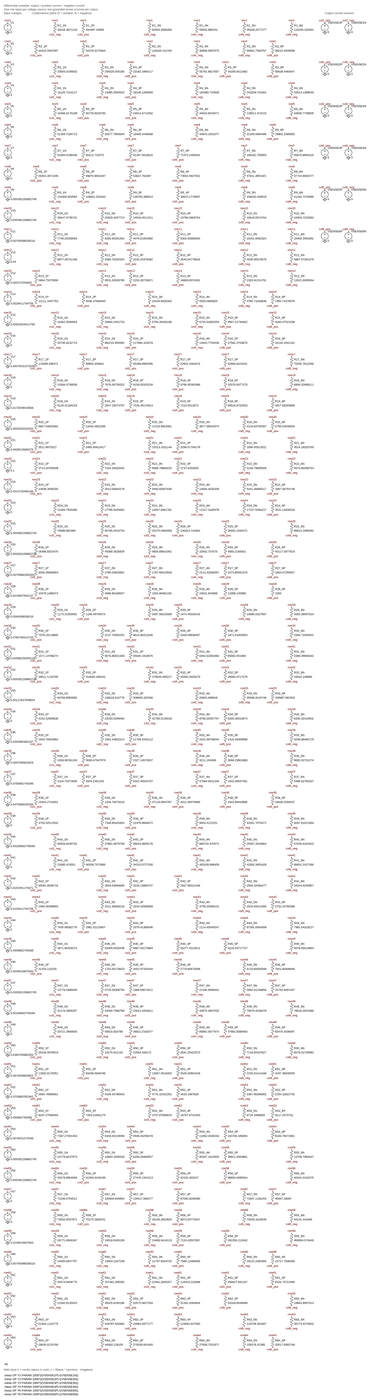
[diagram p0: schematic mnist_digit_3.asc, whole sheet]
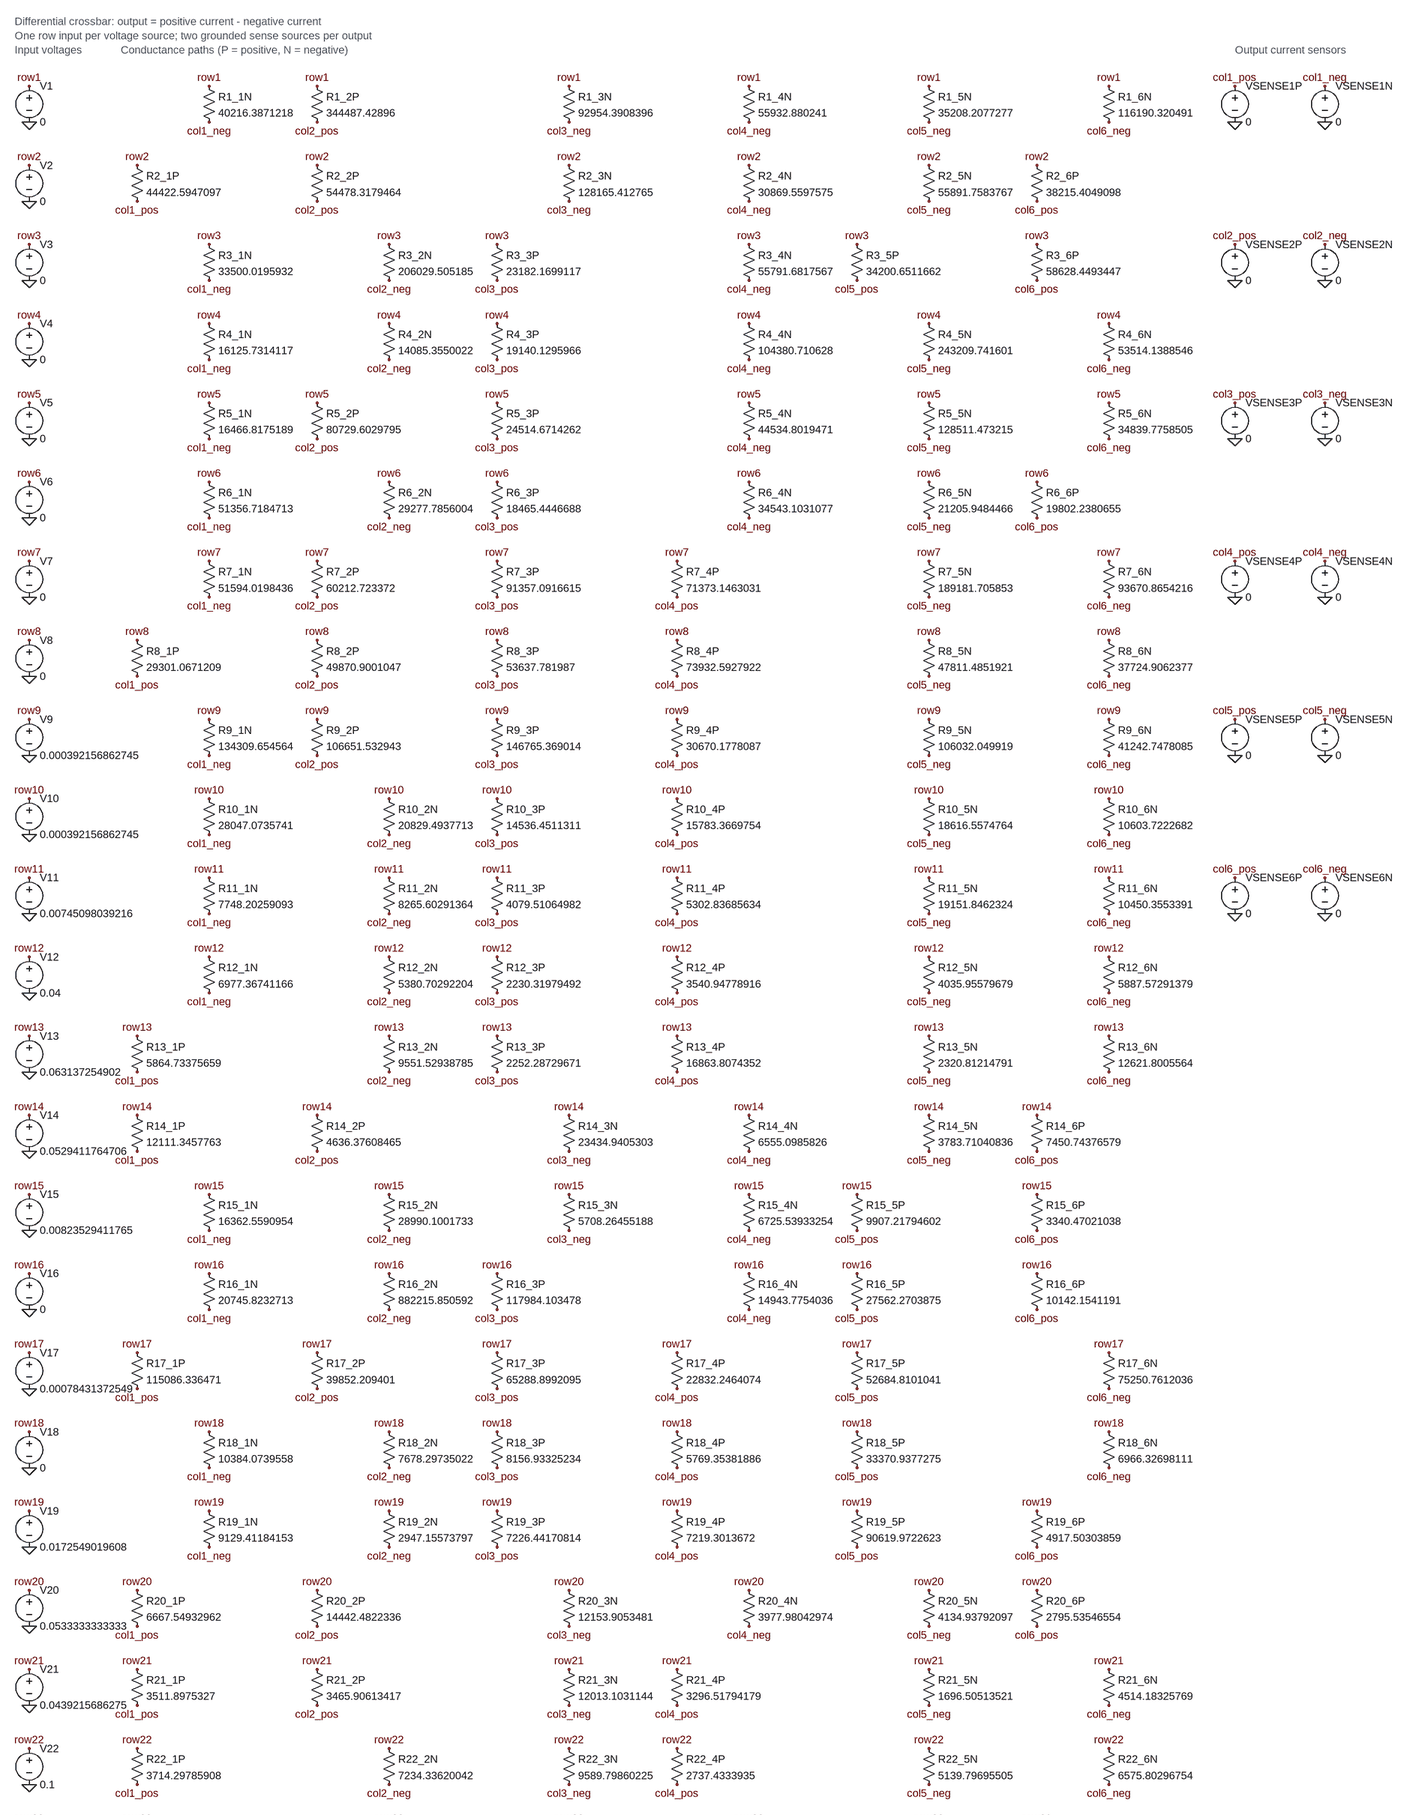
[diagram p1: schematic mnist_digit_3.asc, part, row 1 of 3, column 1 of 1]
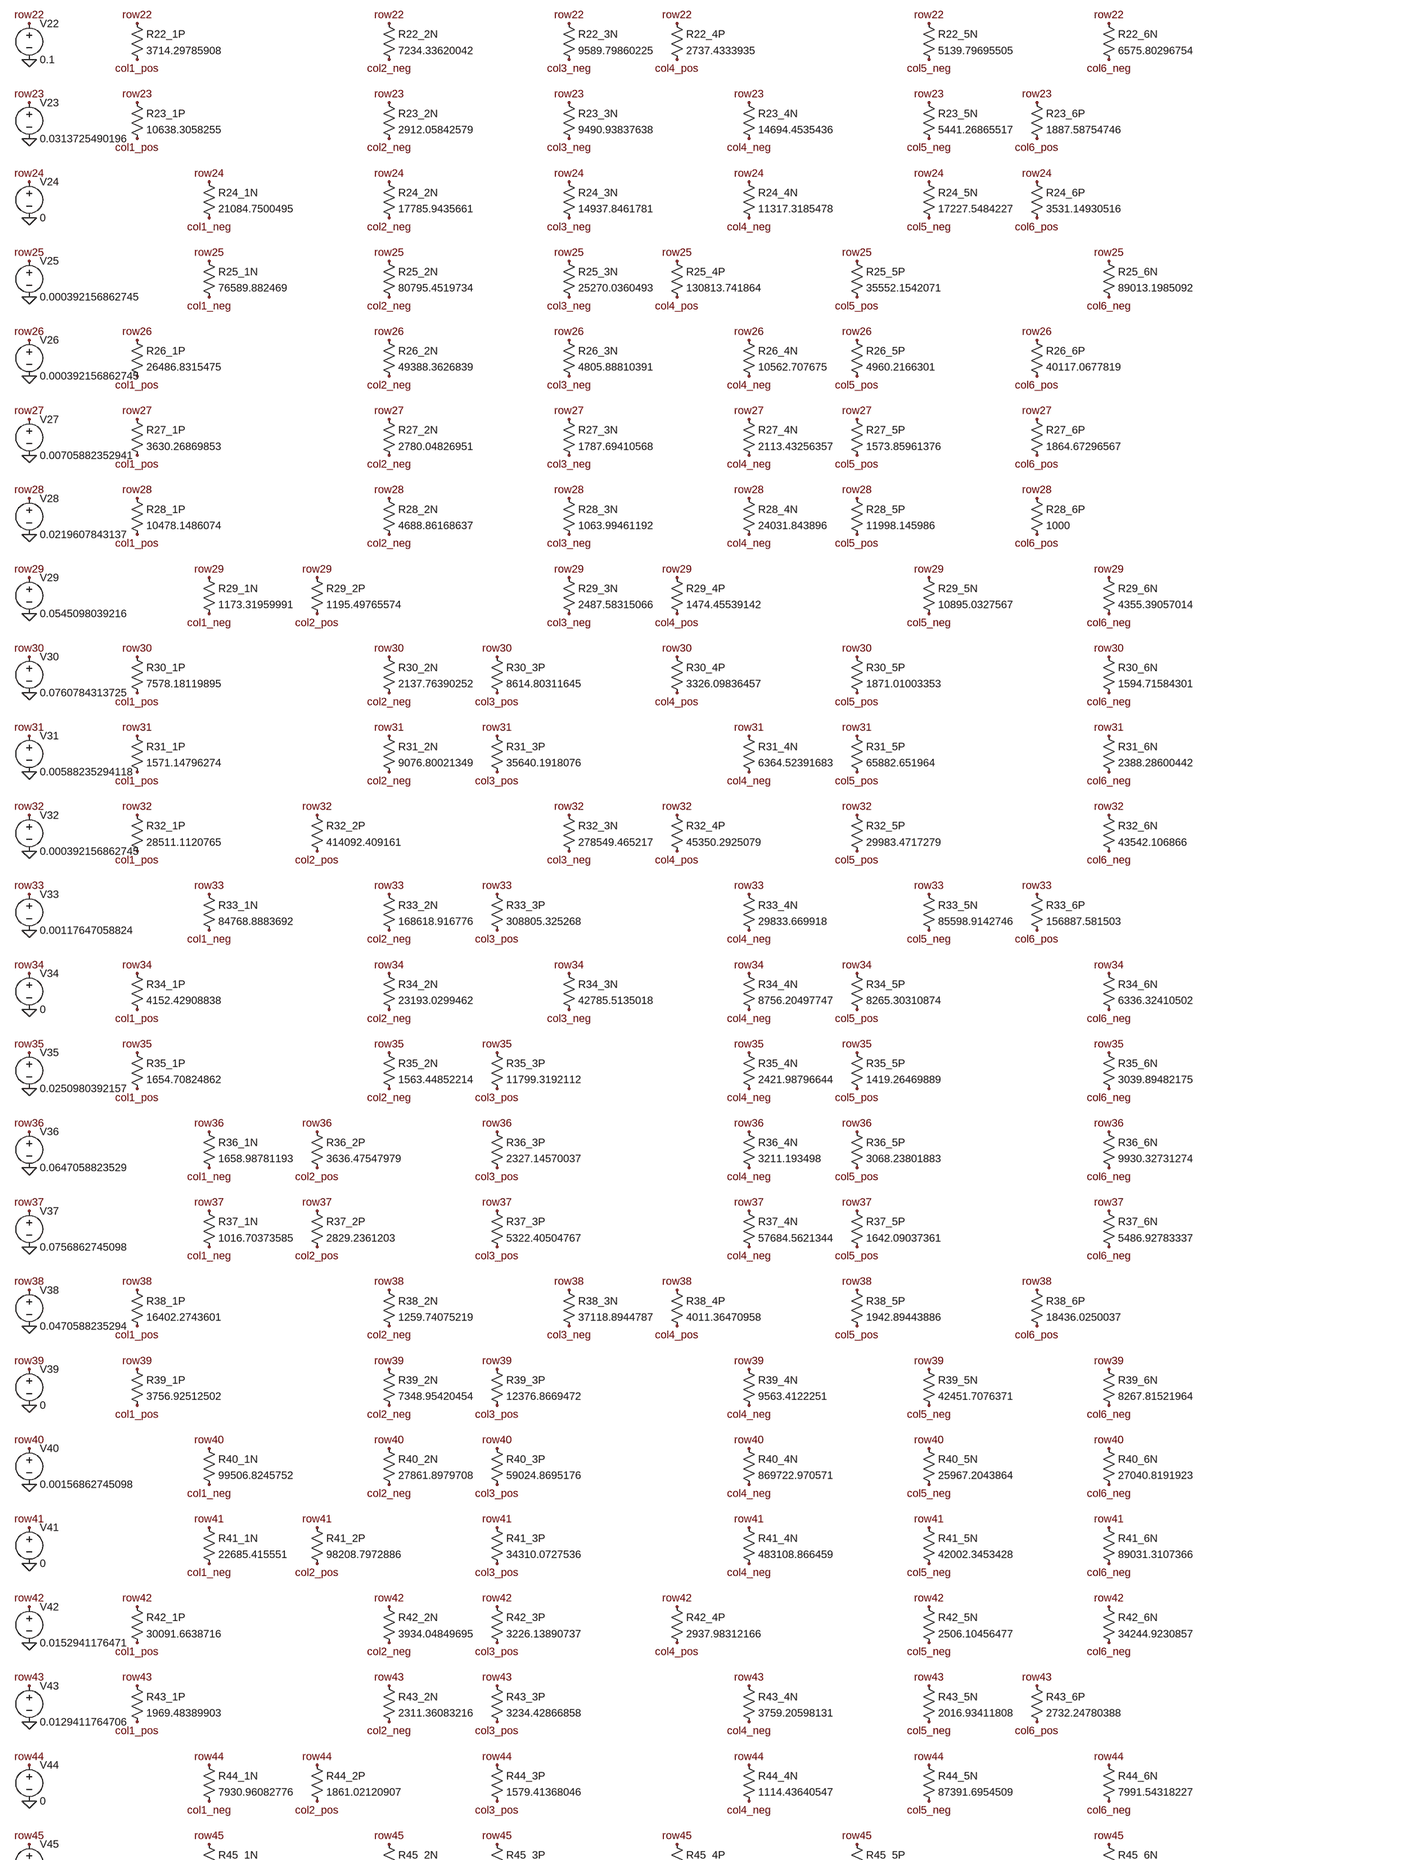
[diagram p2: schematic mnist_digit_3.asc, part, row 2 of 3, column 1 of 1]
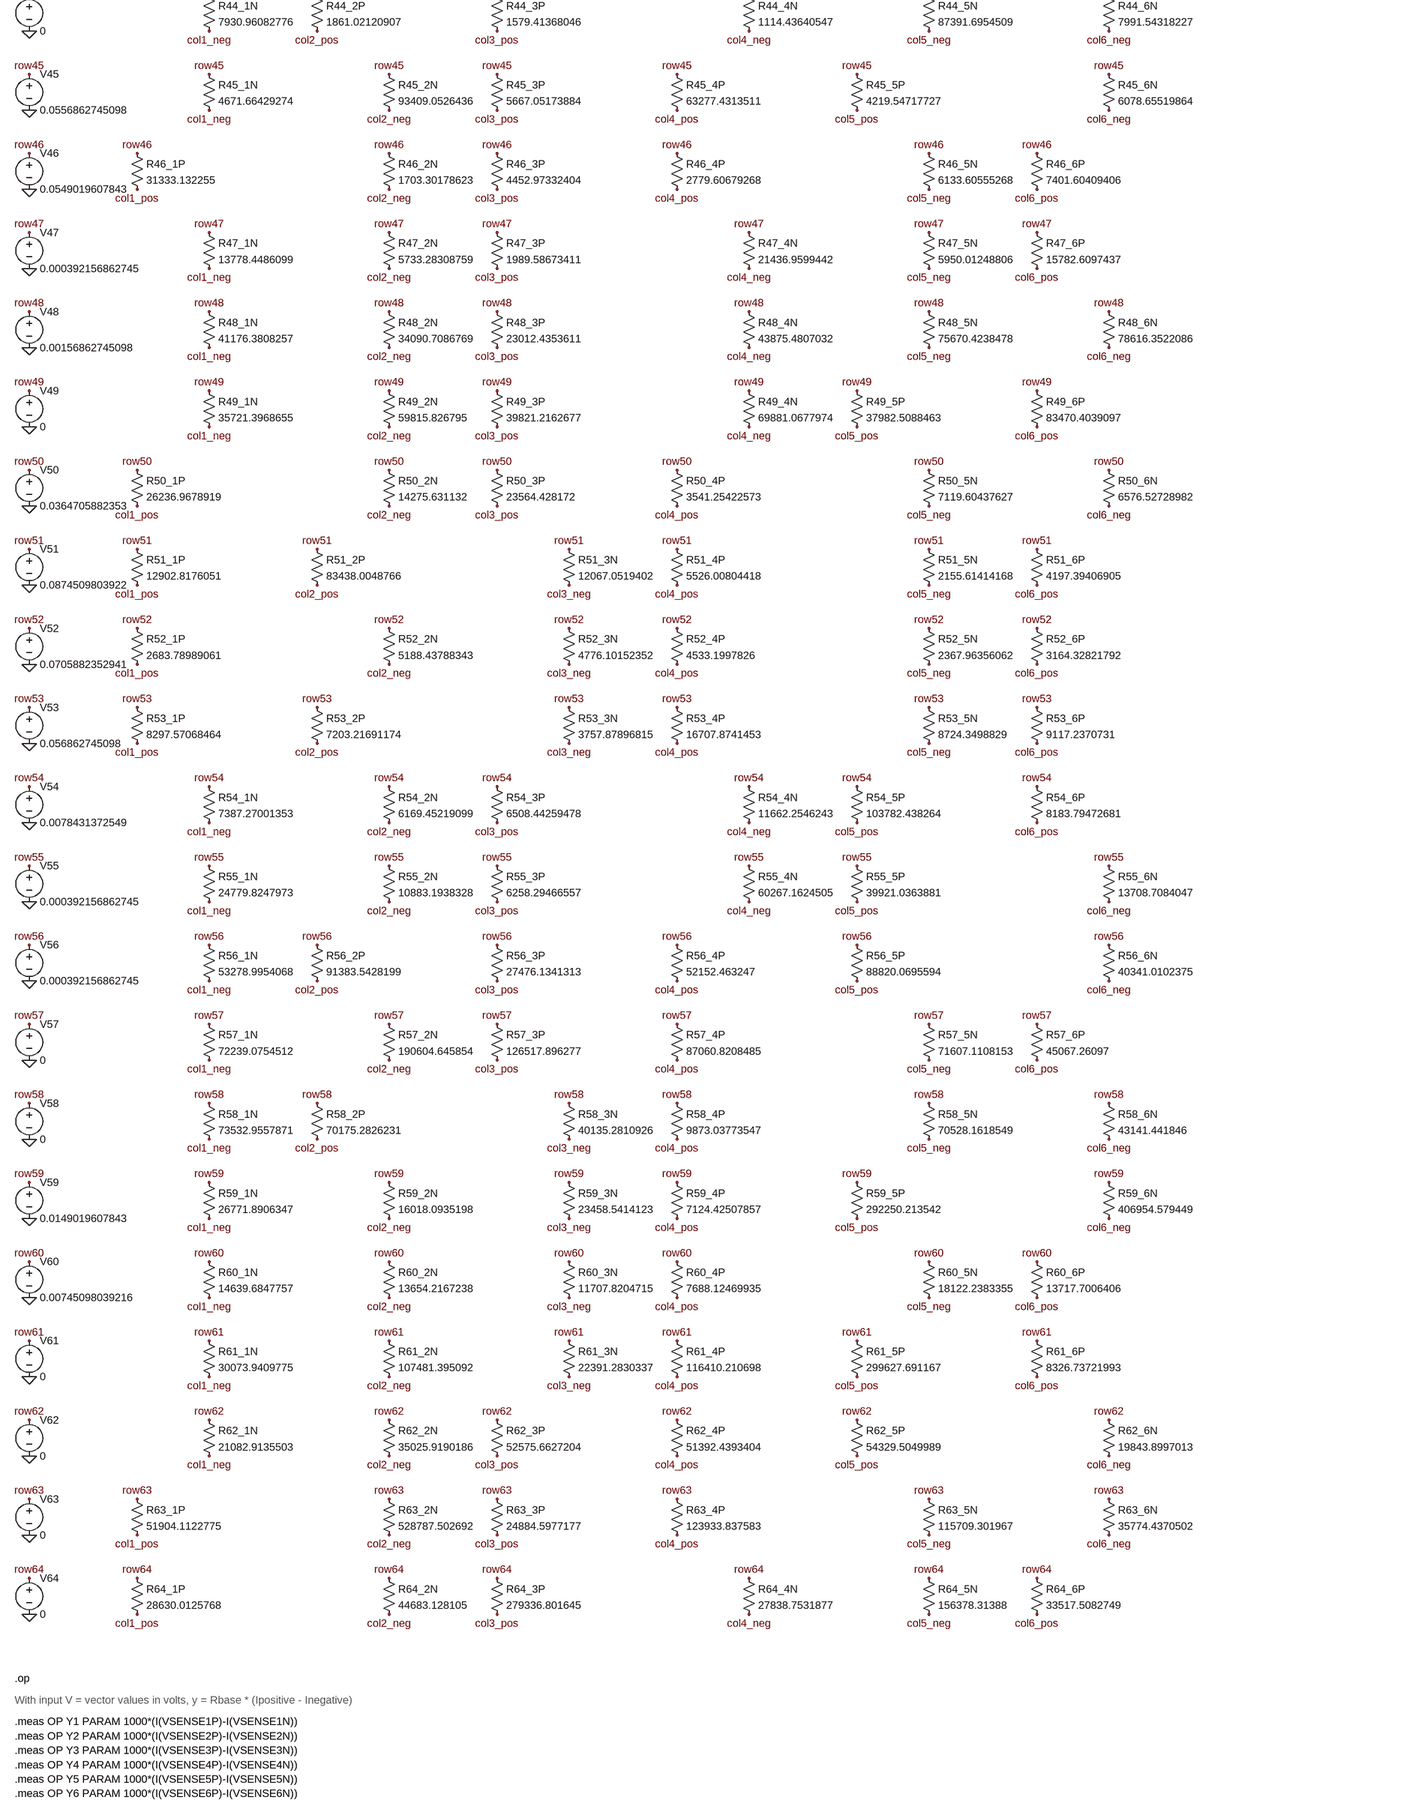
[diagram p3: schematic mnist_digit_3.asc, part, row 3 of 3, column 1 of 1]
* mnist_digit_3.asc
V1 row1 0 0
V2 row2 0 0
V3 row3 0 0
V4 row4 0 0
V5 row5 0 0
V6 row6 0 0
V7 row7 0 0
V8 row8 0 0
V9 row9 0 0.000392156862745
V10 row10 0 0.000392156862745
V11 row11 0 0.00745098039216
V12 row12 0 0.04
V13 row13 0 0.063137254902
V14 row14 0 0.0529411764706
V15 row15 0 0.00823529411765
V16 row16 0 0
V17 row17 0 0.00078431372549
V18 row18 0 0
V19 row19 0 0.0172549019608
V20 row20 0 0.0533333333333
V21 row21 0 0.0439215686275
V22 row22 0 0.1
V23 row23 0 0.0313725490196
V24 row24 0 0
V25 row25 0 0.000392156862745
V26 row26 0 0.000392156862745
V27 row27 0 0.00705882352941
V28 row28 0 0.0219607843137
V29 row29 0 0.0545098039216
V30 row30 0 0.0760784313725
V31 row31 0 0.00588235294118
V32 row32 0 0.000392156862745
V33 row33 0 0.00117647058824
V34 row34 0 0
V35 row35 0 0.0250980392157
V36 row36 0 0.0647058823529
V37 row37 0 0.0756862745098
V38 row38 0 0.0470588235294
V39 row39 0 0
V40 row40 0 0.00156862745098
V41 row41 0 0
V42 row42 0 0.0152941176471
V43 row43 0 0.0129411764706
V44 row44 0 0
V45 row45 0 0.0556862745098
V46 row46 0 0.0549019607843
V47 row47 0 0.000392156862745
V48 row48 0 0.00156862745098
V49 row49 0 0
V50 row50 0 0.0364705882353
V51 row51 0 0.0874509803922
V52 row52 0 0.0705882352941
V53 row53 0 0.056862745098
V54 row54 0 0.0078431372549
V55 row55 0 0.000392156862745
V56 row56 0 0.000392156862745
V57 row57 0 0
V58 row58 0 0
V59 row59 0 0.0149019607843
V60 row60 0 0.00745098039216
V61 row61 0 0
V62 row62 0 0
V63 row63 0 0
V64 row64 0 0
R1_1N row1 col1_neg 40216.3871218
R1_2P row1 col2_pos 344487.42896
R1_3N row1 col3_neg 92954.3908396
R1_4N row1 col4_neg 55932.880241
R1_5N row1 col5_neg 35208.2077277
R1_6N row1 col6_neg 116190.320491
R2_1P row2 col1_pos 44422.5947097
R2_2P row2 col2_pos 54478.3179464
R2_3N row2 col3_neg 128165.412765
R2_4N row2 col4_neg 30869.5597575
R2_5N row2 col5_neg 55891.7583767
R2_6P row2 col6_pos 38215.4049098
R3_1N row3 col1_neg 33500.0195932
R3_2N row3 col2_neg 206029.505185
R3_3P row3 col3_pos 23182.1699117
R3_4N row3 col4_neg 55791.6817567
R3_5P row3 col5_pos 34200.6511662
R3_6P row3 col6_pos 58628.4493447
R4_1N row4 col1_neg 16125.7314117
R4_2N row4 col2_neg 14085.3550022
R4_3P row4 col3_pos 19140.1295966
R4_4N row4 col4_neg 104380.710628
R4_5N row4 col5_neg 243209.741601
R4_6N row4 col6_neg 53514.1388546
R5_1N row5 col1_neg 16466.8175189
R5_2P row5 col2_pos 80729.6029795
R5_3P row5 col3_pos 24514.6714262
R5_4N row5 col4_neg 44534.8019471
R5_5N row5 col5_neg 128511.473215
R5_6N row5 col6_neg 34839.7758505
R6_1N row6 col1_neg 51356.7184713
R6_2N row6 col2_neg 29277.7856004
R6_3P row6 col3_pos 18465.4446688
R6_4N row6 col4_neg 34543.1031077
R6_5N row6 col5_neg 21205.9484466
R6_6P row6 col6_pos 19802.2380655
R7_1N row7 col1_neg 51594.0198436
R7_2P row7 col2_pos 60212.723372
R7_3P row7 col3_pos 91357.0916615
R7_4P row7 col4_pos 71373.1463031
R7_5N row7 col5_neg 189181.705853
R7_6N row7 col6_neg 93670.8654216
R8_1P row8 col1_pos 29301.0671209
R8_2P row8 col2_pos 49870.9001047
R8_3P row8 col3_pos 53637.781987
R8_4P row8 col4_pos 73932.5927922
R8_5N row8 col5_neg 47811.4851921
R8_6N row8 col6_neg 37724.9062377
R9_1N row9 col1_neg 134309.654564
R9_2P row9 col2_pos 106651.532943
R9_3P row9 col3_pos 146765.369014
R9_4P row9 col4_pos 30670.1778087
R9_5N row9 col5_neg 106032.049919
R9_6N row9 col6_neg 41242.7478085
R10_1N row10 col1_neg 28047.0735741
R10_2N row10 col2_neg 20829.4937713
R10_3P row10 col3_pos 14536.4511311
R10_4P row10 col4_pos 15783.3669754
R10_5N row10 col5_neg 18616.5574764
R10_6N row10 col6_neg 10603.7222682
R11_1N row11 col1_neg 7748.20259093
R11_2N row11 col2_neg 8265.60291364
R11_3P row11 col3_pos 4079.51064982
R11_4P row11 col4_pos 5302.83685634
R11_5N row11 col5_neg 19151.8462324
R11_6N row11 col6_neg 10450.3553391
R12_1N row12 col1_neg 6977.36741166
R12_2N row12 col2_neg 5380.70292204
R12_3P row12 col3_pos 2230.31979492
R12_4P row12 col4_pos 3540.94778916
R12_5N row12 col5_neg 4035.95579679
R12_6N row12 col6_neg 5887.57291379
R13_1P row13 col1_pos 5864.73375659
R13_2N row13 col2_neg 9551.52938785
R13_3P row13 col3_pos 2252.28729671
R13_4P row13 col4_pos 16863.8074352
R13_5N row13 col5_neg 2320.81214791
R13_6N row13 col6_neg 12621.8005564
R14_1P row14 col1_pos 12111.3457763
R14_2P row14 col2_pos 4636.37608465
R14_3N row14 col3_neg 23434.9405303
R14_4N row14 col4_neg 6555.0985826
R14_5N row14 col5_neg 3783.71040836
R14_6P row14 col6_pos 7450.74376579
R15_1N row15 col1_neg 16362.5590954
R15_2N row15 col2_neg 28990.1001733
R15_3N row15 col3_neg 5708.26455188
R15_4N row15 col4_neg 6725.53933254
R15_5P row15 col5_pos 9907.21794602
R15_6P row15 col6_pos 3340.47021038
R16_1N row16 col1_neg 20745.8232713
R16_2N row16 col2_neg 882215.850592
R16_3P row16 col3_pos 117984.103478
R16_4N row16 col4_neg 14943.7754036
R16_5P row16 col5_pos 27562.2703875
R16_6P row16 col6_pos 10142.1541191
R17_1P row17 col1_pos 115086.336471
R17_2P row17 col2_pos 39852.209401
R17_3P row17 col3_pos 65288.8992095
R17_4P row17 col4_pos 22832.2464074
R17_5P row17 col5_pos 52684.8101041
R17_6N row17 col6_neg 75250.7612036
R18_1N row18 col1_neg 10384.0739558
R18_2N row18 col2_neg 7678.29735022
R18_3P row18 col3_pos 8156.93325234
R18_4P row18 col4_pos 5769.35381886
R18_5P row18 col5_pos 33370.9377275
R18_6N row18 col6_neg 6966.32698111
R19_1N row19 col1_neg 9129.41184153
R19_2N row19 col2_neg 2947.15573797
R19_3P row19 col3_pos 7226.44170814
R19_4P row19 col4_pos 7219.3013672
R19_5P row19 col5_pos 90619.9722623
R19_6P row19 col6_pos 4917.50303859
R20_1P row20 col1_pos 6667.54932962
R20_2P row20 col2_pos 14442.4822336
R20_3N row20 col3_neg 12153.9053481
R20_4N row20 col4_neg 3977.98042974
R20_5N row20 col5_neg 4134.93792097
R20_6P row20 col6_pos 2795.53546554
R21_1P row21 col1_pos 3511.8975327
R21_2P row21 col2_pos 3465.90613417
R21_3N row21 col3_neg 12013.1031144
R21_4P row21 col4_pos 3296.51794179
R21_5N row21 col5_neg 1696.50513521
R21_6N row21 col6_neg 4514.18325769
R22_1P row22 col1_pos 3714.29785908
R22_2N row22 col2_neg 7234.33620042
R22_3N row22 col3_neg 9589.79860225
R22_4P row22 col4_pos 2737.4333935
R22_5N row22 col5_neg 5139.79695505
R22_6N row22 col6_neg 6575.80296754
R23_1P row23 col1_pos 10638.3058255
R23_2N row23 col2_neg 2912.05842579
R23_3N row23 col3_neg 9490.93837638
R23_4N row23 col4_neg 14694.4535436
R23_5N row23 col5_neg 5441.26865517
R23_6P row23 col6_pos 1887.58754746
R24_1N row24 col1_neg 21084.7500495
R24_2N row24 col2_neg 17785.9435661
R24_3N row24 col3_neg 14937.8461781
R24_4N row24 col4_neg 11317.3185478
R24_5N row24 col5_neg 17227.5484227
R24_6P row24 col6_pos 3531.14930516
R25_1N row25 col1_neg 76589.882469
R25_2N row25 col2_neg 80795.4519734
R25_3N row25 col3_neg 25270.0360493
R25_4P row25 col4_pos 130813.741864
R25_5P row25 col5_pos 35552.1542071
R25_6N row25 col6_neg 89013.1985092
R26_1P row26 col1_pos 26486.8315475
R26_2N row26 col2_neg 49388.3626839
R26_3N row26 col3_neg 4805.88810391
R26_4N row26 col4_neg 10562.707675
R26_5P row26 col5_pos 4960.2166301
R26_6P row26 col6_pos 40117.0677819
R27_1P row27 col1_pos 3630.26869853
R27_2N row27 col2_neg 2780.04826951
R27_3N row27 col3_neg 1787.69410568
R27_4N row27 col4_neg 2113.43256357
R27_5P row27 col5_pos 1573.85961376
R27_6P row27 col6_pos 1864.67296567
R28_1P row28 col1_pos 10478.1486074
R28_2N row28 col2_neg 4688.86168637
R28_3N row28 col3_neg 1063.99461192
R28_4N row28 col4_neg 24031.843896
R28_5P row28 col5_pos 11998.145986
R28_6P row28 col6_pos 1000
R29_1N row29 col1_neg 1173.31959991
R29_2P row29 col2_pos 1195.49765574
R29_3N row29 col3_neg 2487.58315066
R29_4P row29 col4_pos 1474.45539142
R29_5N row29 col5_neg 10895.0327567
R29_6N row29 col6_neg 4355.39057014
R30_1P row30 col1_pos 7578.18119895
R30_2N row30 col2_neg 2137.76390252
R30_3P row30 col3_pos 8614.80311645
R30_4P row30 col4_pos 3326.09836457
R30_5P row30 col5_pos 1871.01003353
R30_6N row30 col6_neg 1594.71584301
R31_1P row31 col1_pos 1571.14796274
R31_2N row31 col2_neg 9076.80021349
R31_3P row31 col3_pos 35640.1918076
R31_4N row31 col4_neg 6364.52391683
R31_5P row31 col5_pos 65882.651964
R31_6N row31 col6_neg 2388.28600442
R32_1P row32 col1_pos 28511.1120765
R32_2P row32 col2_pos 414092.409161
R32_3N row32 col3_neg 278549.465217
R32_4P row32 col4_pos 45350.2925079
R32_5P row32 col5_pos 29983.4717279
R32_6N row32 col6_neg 43542.106866
R33_1N row33 col1_neg 84768.8883692
R33_2N row33 col2_neg 168618.916776
R33_3P row33 col3_pos 308805.325268
R33_4N row33 col4_neg 29833.669918
R33_5N row33 col5_neg 85598.9142746
R33_6P row33 col6_pos 156887.581503
R34_1P row34 col1_pos 4152.42908838
R34_2N row34 col2_neg 23193.0299462
R34_3N row34 col3_neg 42785.5135018
R34_4N row34 col4_neg 8756.20497747
R34_5P row34 col5_pos 8265.30310874
R34_6N row34 col6_neg 6336.32410502
R35_1P row35 col1_pos 1654.70824862
R35_2N row35 col2_neg 1563.44852214
R35_3P row35 col3_pos 11799.3192112
R35_4N row35 col4_neg 2421.98796644
R35_5P row35 col5_pos 1419.26469889
R35_6N row35 col6_neg 3039.89482175
R36_1N row36 col1_neg 1658.98781193
R36_2P row36 col2_pos 3636.47547979
R36_3P row36 col3_pos 2327.14570037
R36_4N row36 col4_neg 3211.193498
R36_5P row36 col5_pos 3068.23801883
R36_6N row36 col6_neg 9930.32731274
R37_1N row37 col1_neg 1016.70373585
R37_2P row37 col2_pos 2829.2361203
R37_3P row37 col3_pos 5322.40504767
R37_4N row37 col4_neg 57684.5621344
R37_5P row37 col5_pos 1642.09037361
R37_6N row37 col6_neg 5486.92783337
R38_1P row38 col1_pos 16402.2743601
R38_2N row38 col2_neg 1259.74075219
R38_3N row38 col3_neg 37118.8944787
R38_4P row38 col4_pos 4011.36470958
R38_5P row38 col5_pos 1942.89443886
R38_6P row38 col6_pos 18436.0250037
R39_1P row39 col1_pos 3756.92512502
R39_2N row39 col2_neg 7348.95420454
R39_3P row39 col3_pos 12376.8669472
R39_4N row39 col4_neg 9563.4122251
R39_5N row39 col5_neg 42451.7076371
R39_6N row39 col6_neg 8267.81521964
R40_1N row40 col1_neg 99506.8245752
R40_2N row40 col2_neg 27861.8979708
R40_3P row40 col3_pos 59024.8695176
R40_4N row40 col4_neg 869722.970571
R40_5N row40 col5_neg 25967.2043864
R40_6N row40 col6_neg 27040.8191923
R41_1N row41 col1_neg 22685.415551
R41_2P row41 col2_pos 98208.7972886
R41_3P row41 col3_pos 34310.0727536
R41_4N row41 col4_neg 483108.866459
R41_5N row41 col5_neg 42002.3453428
R41_6N row41 col6_neg 89031.3107366
R42_1P row42 col1_pos 30091.6638716
R42_2N row42 col2_neg 3934.04849695
R42_3P row42 col3_pos 3226.13890737
R42_4P row42 col4_pos 2937.98312166
R42_5N row42 col5_neg 2506.10456477
R42_6N row42 col6_neg 34244.9230857
R43_1P row43 col1_pos 1969.48389903
R43_2N row43 col2_neg 2311.36083216
R43_3P row43 col3_pos 3234.42866858
R43_4N row43 col4_neg 3759.20598131
R43_5N row43 col5_neg 2016.93411808
R43_6P row43 col6_pos 2732.24780388
R44_1N row44 col1_neg 7930.96082776
R44_2P row44 col2_pos 1861.02120907
R44_3P row44 col3_pos 1579.41368046
R44_4N row44 col4_neg 1114.43640547
R44_5N row44 col5_neg 87391.6954509
R44_6N row44 col6_neg 7991.54318227
R45_1N row45 col1_neg 4671.66429274
R45_2N row45 col2_neg 93409.0526436
R45_3P row45 col3_pos 5667.05173884
R45_4P row45 col4_pos 63277.4313511
R45_5P row45 col5_pos 4219.54717727
R45_6N row45 col6_neg 6078.65519864
R46_1P row46 col1_pos 31333.132255
R46_2N row46 col2_neg 1703.30178623
R46_3P row46 col3_pos 4452.97332404
R46_4P row46 col4_pos 2779.60679268
R46_5N row46 col5_neg 6133.60555268
R46_6P row46 col6_pos 7401.60409406
R47_1N row47 col1_neg 13778.4486099
R47_2N row47 col2_neg 5733.28308759
R47_3P row47 col3_pos 1989.58673411
R47_4N row47 col4_neg 21436.9599442
R47_5N row47 col5_neg 5950.01248806
R47_6P row47 col6_pos 15782.6097437
R48_1N row48 col1_neg 41176.3808257
R48_2N row48 col2_neg 34090.7086769
R48_3P row48 col3_pos 23012.4353611
R48_4N row48 col4_neg 43875.4807032
R48_5N row48 col5_neg 75670.4238478
R48_6N row48 col6_neg 78616.3522086
R49_1N row49 col1_neg 35721.3968655
R49_2N row49 col2_neg 59815.826795
R49_3P row49 col3_pos 39821.2162677
R49_4N row49 col4_neg 69881.0677974
R49_5P row49 col5_pos 37982.5088463
R49_6P row49 col6_pos 83470.4039097
R50_1P row50 col1_pos 26236.9678919
R50_2N row50 col2_neg 14275.631132
R50_3P row50 col3_pos 23564.428172
R50_4P row50 col4_pos 3541.25422573
R50_5N row50 col5_neg 7119.60437627
R50_6N row50 col6_neg 6576.52728982
R51_1P row51 col1_pos 12902.8176051
R51_2P row51 col2_pos 83438.0048766
R51_3N row51 col3_neg 12067.0519402
R51_4P row51 col4_pos 5526.00804418
R51_5N row51 col5_neg 2155.61414168
R51_6P row51 col6_pos 4197.39406905
R52_1P row52 col1_pos 2683.78989061
R52_2N row52 col2_neg 5188.43788343
R52_3N row52 col3_neg 4776.10152352
R52_4P row52 col4_pos 4533.1997826
R52_5N row52 col5_neg 2367.96356062
R52_6P row52 col6_pos 3164.32821792
R53_1P row53 col1_pos 8297.57068464
R53_2P row53 col2_pos 7203.21691174
R53_3N row53 col3_neg 3757.87896815
R53_4P row53 col4_pos 16707.8741453
R53_5N row53 col5_neg 8724.3498829
R53_6P row53 col6_pos 9117.2370731
R54_1N row54 col1_neg 7387.27001353
R54_2N row54 col2_neg 6169.45219099
R54_3P row54 col3_pos 6508.44259478
R54_4N row54 col4_neg 11662.2546243
R54_5P row54 col5_pos 103782.438264
R54_6P row54 col6_pos 8183.79472681
R55_1N row55 col1_neg 24779.8247973
R55_2N row55 col2_neg 10883.1938328
R55_3P row55 col3_pos 6258.29466557
R55_4N row55 col4_neg 60267.1624505
R55_5P row55 col5_pos 39921.0363881
R55_6N row55 col6_neg 13708.7084047
R56_1N row56 col1_neg 53278.9954068
R56_2P row56 col2_pos 91383.5428199
R56_3P row56 col3_pos 27476.1341313
R56_4P row56 col4_pos 52152.463247
R56_5P row56 col5_pos 88820.0695594
R56_6N row56 col6_neg 40341.0102375
R57_1N row57 col1_neg 72239.0754512
R57_2N row57 col2_neg 190604.645854
R57_3P row57 col3_pos 126517.896277
R57_4P row57 col4_pos 87060.8208485
R57_5N row57 col5_neg 71607.1108153
R57_6P row57 col6_pos 45067.26097
R58_1N row58 col1_neg 73532.9557871
R58_2P row58 col2_pos 70175.2826231
R58_3N row58 col3_neg 40135.2810926
R58_4P row58 col4_pos 9873.03773547
R58_5N row58 col5_neg 70528.1618549
R58_6N row58 col6_neg 43141.441846
R59_1N row59 col1_neg 26771.8906347
R59_2N row59 col2_neg 16018.0935198
R59_3N row59 col3_neg 23458.5414123
R59_4P row59 col4_pos 7124.42507857
R59_5P row59 col5_pos 292250.213542
R59_6N row59 col6_neg 406954.579449
R60_1N row60 col1_neg 14639.6847757
R60_2N row60 col2_neg 13654.2167238
R60_3N row60 col3_neg 11707.8204715
R60_4P row60 col4_pos 7688.12469935
R60_5N row60 col5_neg 18122.2383355
R60_6P row60 col6_pos 13717.7006406
R61_1N row61 col1_neg 30073.9409775
R61_2N row61 col2_neg 107481.395092
R61_3N row61 col3_neg 22391.2830337
R61_4P row61 col4_pos 116410.210698
R61_5P row61 col5_pos 299627.691167
R61_6P row61 col6_pos 8326.73721993
R62_1N row62 col1_neg 21082.9135503
R62_2N row62 col2_neg 35025.9190186
R62_3P row62 col3_pos 52575.6627204
R62_4P row62 col4_pos 51392.4393404
R62_5P row62 col5_pos 54329.5049989
R62_6N row62 col6_neg 19843.8997013
R63_1P row63 col1_pos 51904.1122775
R63_2N row63 col2_neg 528787.502692
R63_3P row63 col3_pos 24884.5977177
R63_4P row63 col4_pos 123933.837583
R63_5N row63 col5_neg 115709.301967
R63_6N row63 col6_neg 35774.4370502
R64_1P row64 col1_pos 28630.0125768
R64_2N row64 col2_neg 44683.128105
R64_3P row64 col3_pos 279336.801645
R64_4N row64 col4_neg 27838.7531877
R64_5N row64 col5_neg 156378.31388
R64_6P row64 col6_pos 33517.5082749
VSENSE1P col1_pos 0 0
VSENSE1N col1_neg 0 0
VSENSE2P col2_pos 0 0
VSENSE2N col2_neg 0 0
VSENSE3P col3_pos 0 0
VSENSE3N col3_neg 0 0
VSENSE4P col4_pos 0 0
VSENSE4N col4_neg 0 0
VSENSE5P col5_pos 0 0
VSENSE5N col5_neg 0 0
VSENSE6P col6_pos 0 0
VSENSE6N col6_neg 0 0
* Differential crossbar: output = positive current - negative current
* One row input per voltage source; two grounded sense sources per output
* Input voltages
* Conductance paths (P = positive, N = negative)
* Output current sensors
.op
* With input V = vector values in volts, y = Rbase * (Ipositive - Inegative)
.meas OP Y1 PARAM 1000*(I(VSENSE1P)-I(VSENSE1N))
.meas OP Y2 PARAM 1000*(I(VSENSE2P)-I(VSENSE2N))
.meas OP Y3 PARAM 1000*(I(VSENSE3P)-I(VSENSE3N))
.meas OP Y4 PARAM 1000*(I(VSENSE4P)-I(VSENSE4N))
.meas OP Y5 PARAM 1000*(I(VSENSE5P)-I(VSENSE5N))
.meas OP Y6 PARAM 1000*(I(VSENSE6P)-I(VSENSE6N))
.backanno
.end